# EasyEDA Pro project ProPrj_CactusConKids14_2026-02-14.epro, schematic CCK14 Schematic

## Sheets
1 MCU and Power: Board Name: CCK14 Board; Create Date: 2025-10-09; Page Name: MCU and Power; Project Name: CactusConKids14; Schematic Name: CCK14 Schematic; Update Date: 2025-12-01; Company: EasyEDA.com; Page Size: A4; Version: V1.0
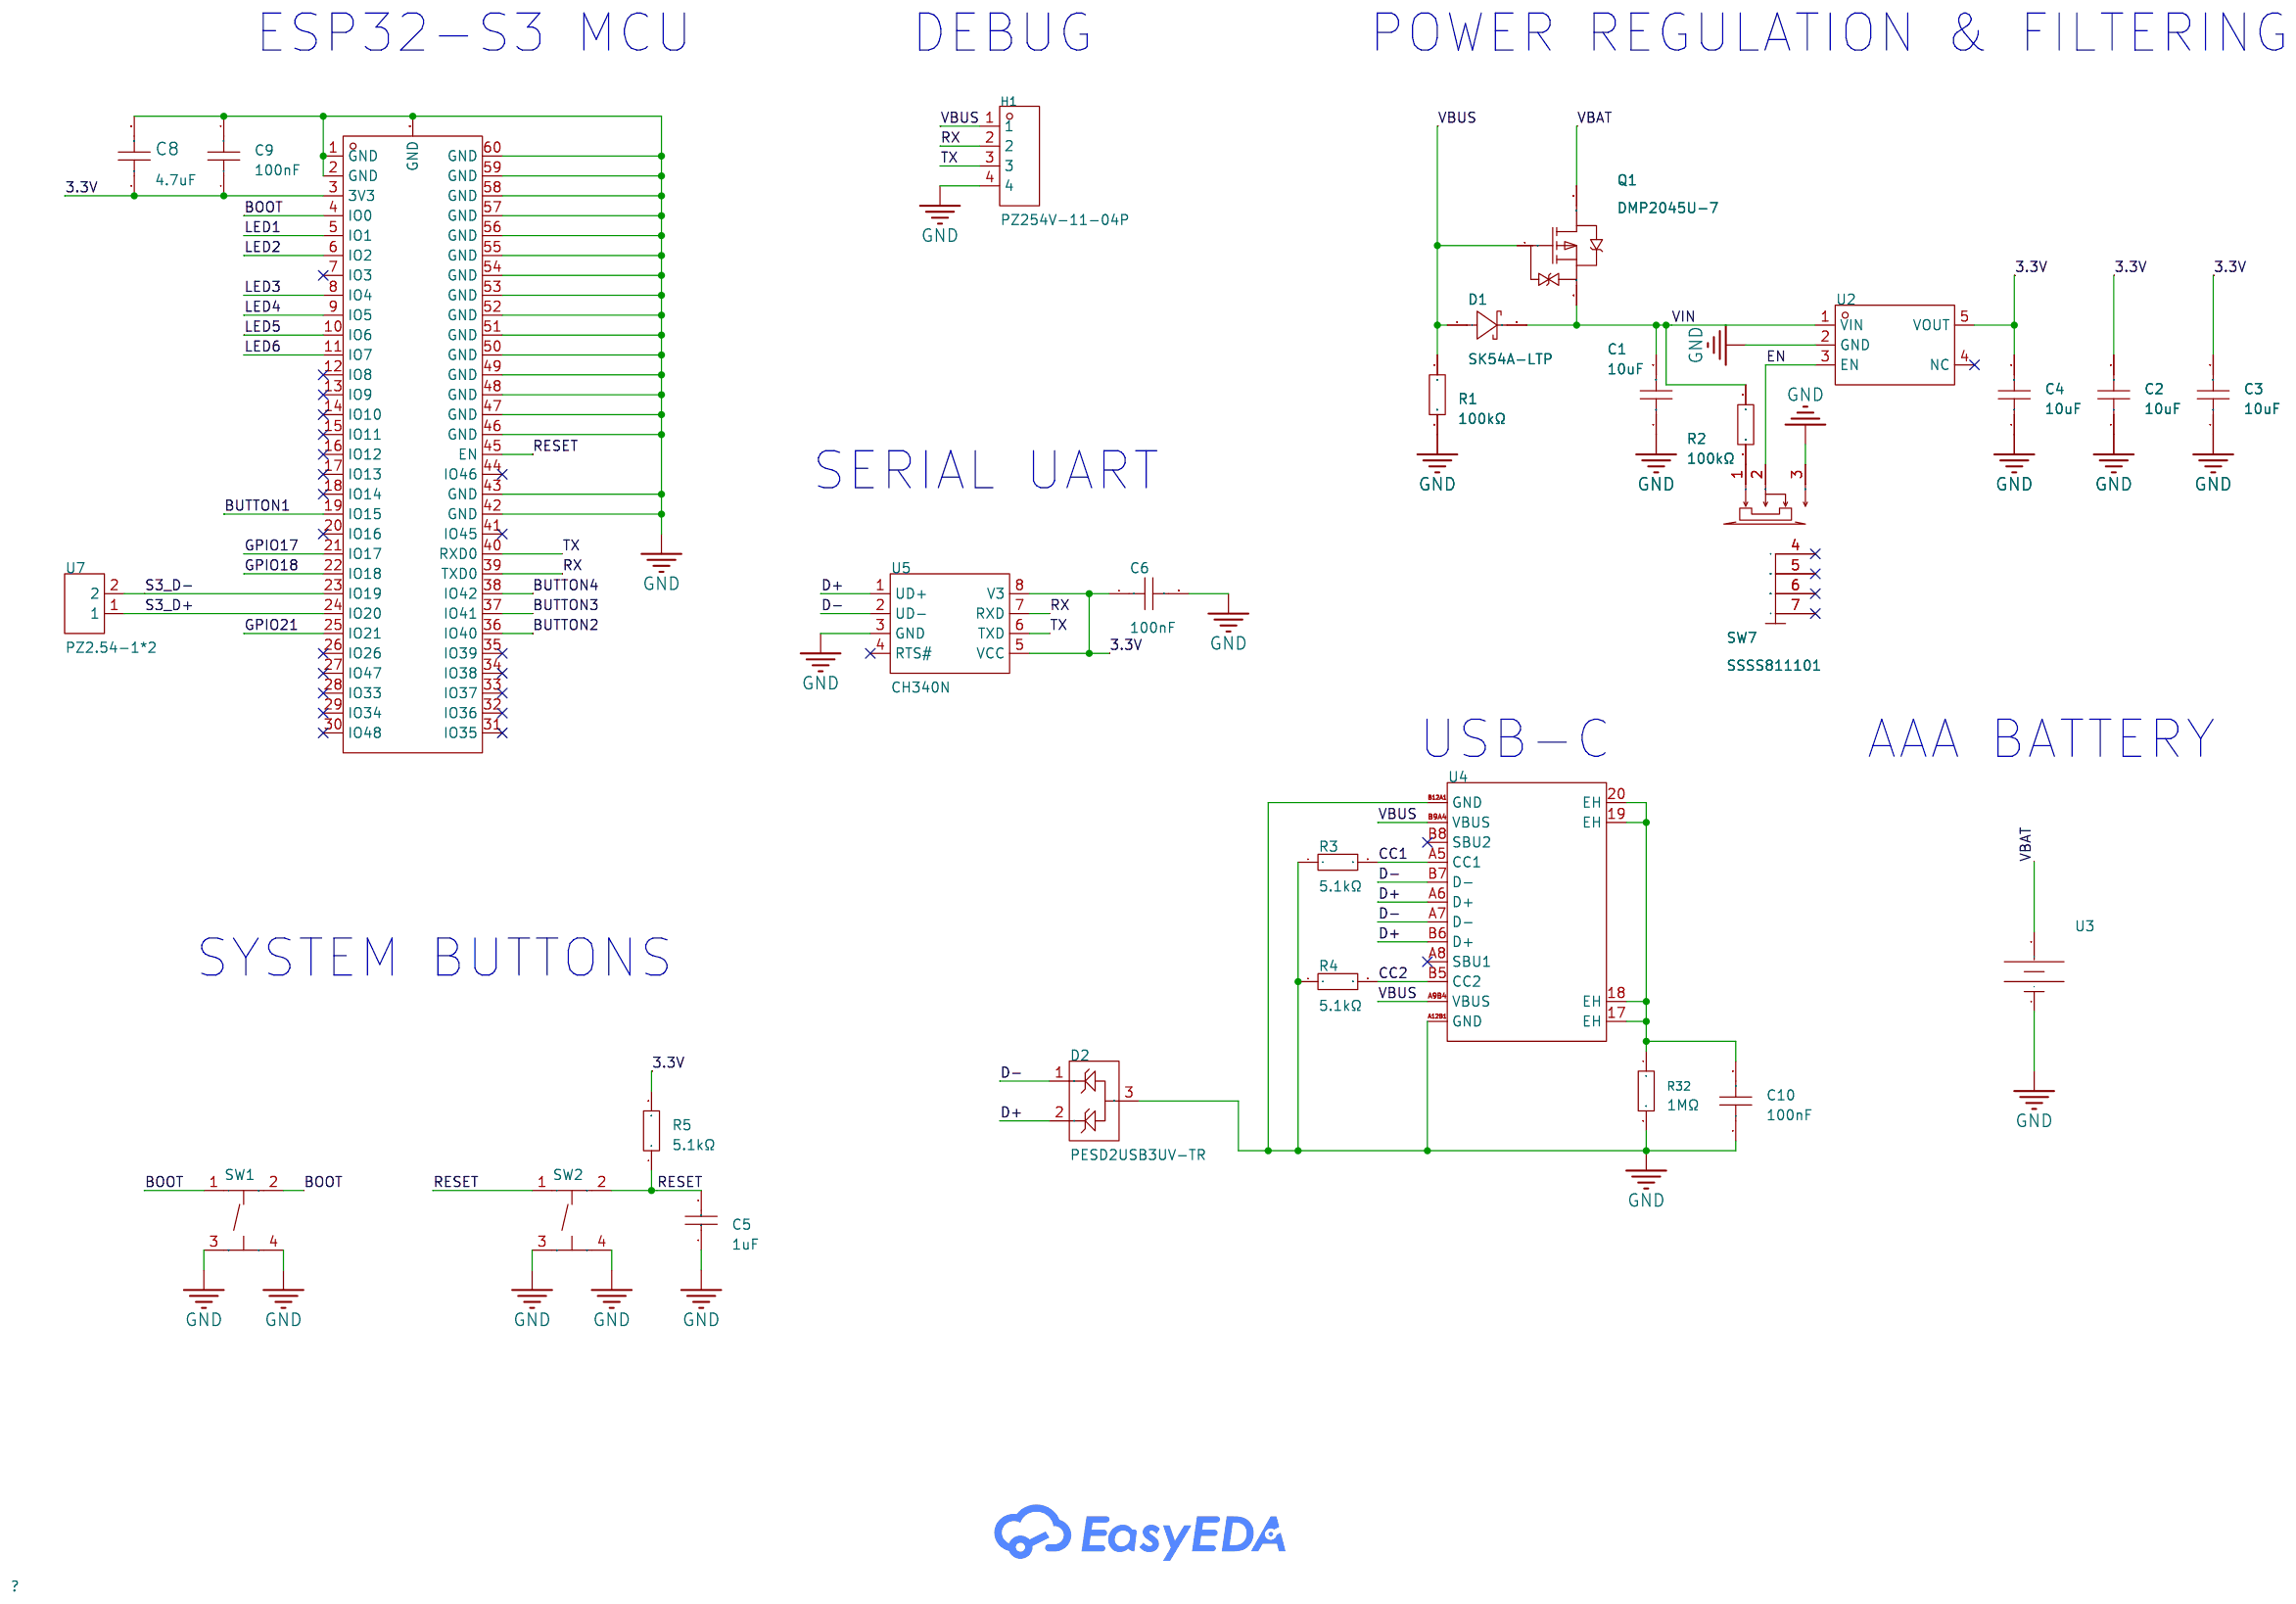
[diagram p0: MCU and Power]
2 Buttons and LEDs: Create Date: 2025-10-13; Page Name: Buttons and LEDs; Update Date: 2025-11-29
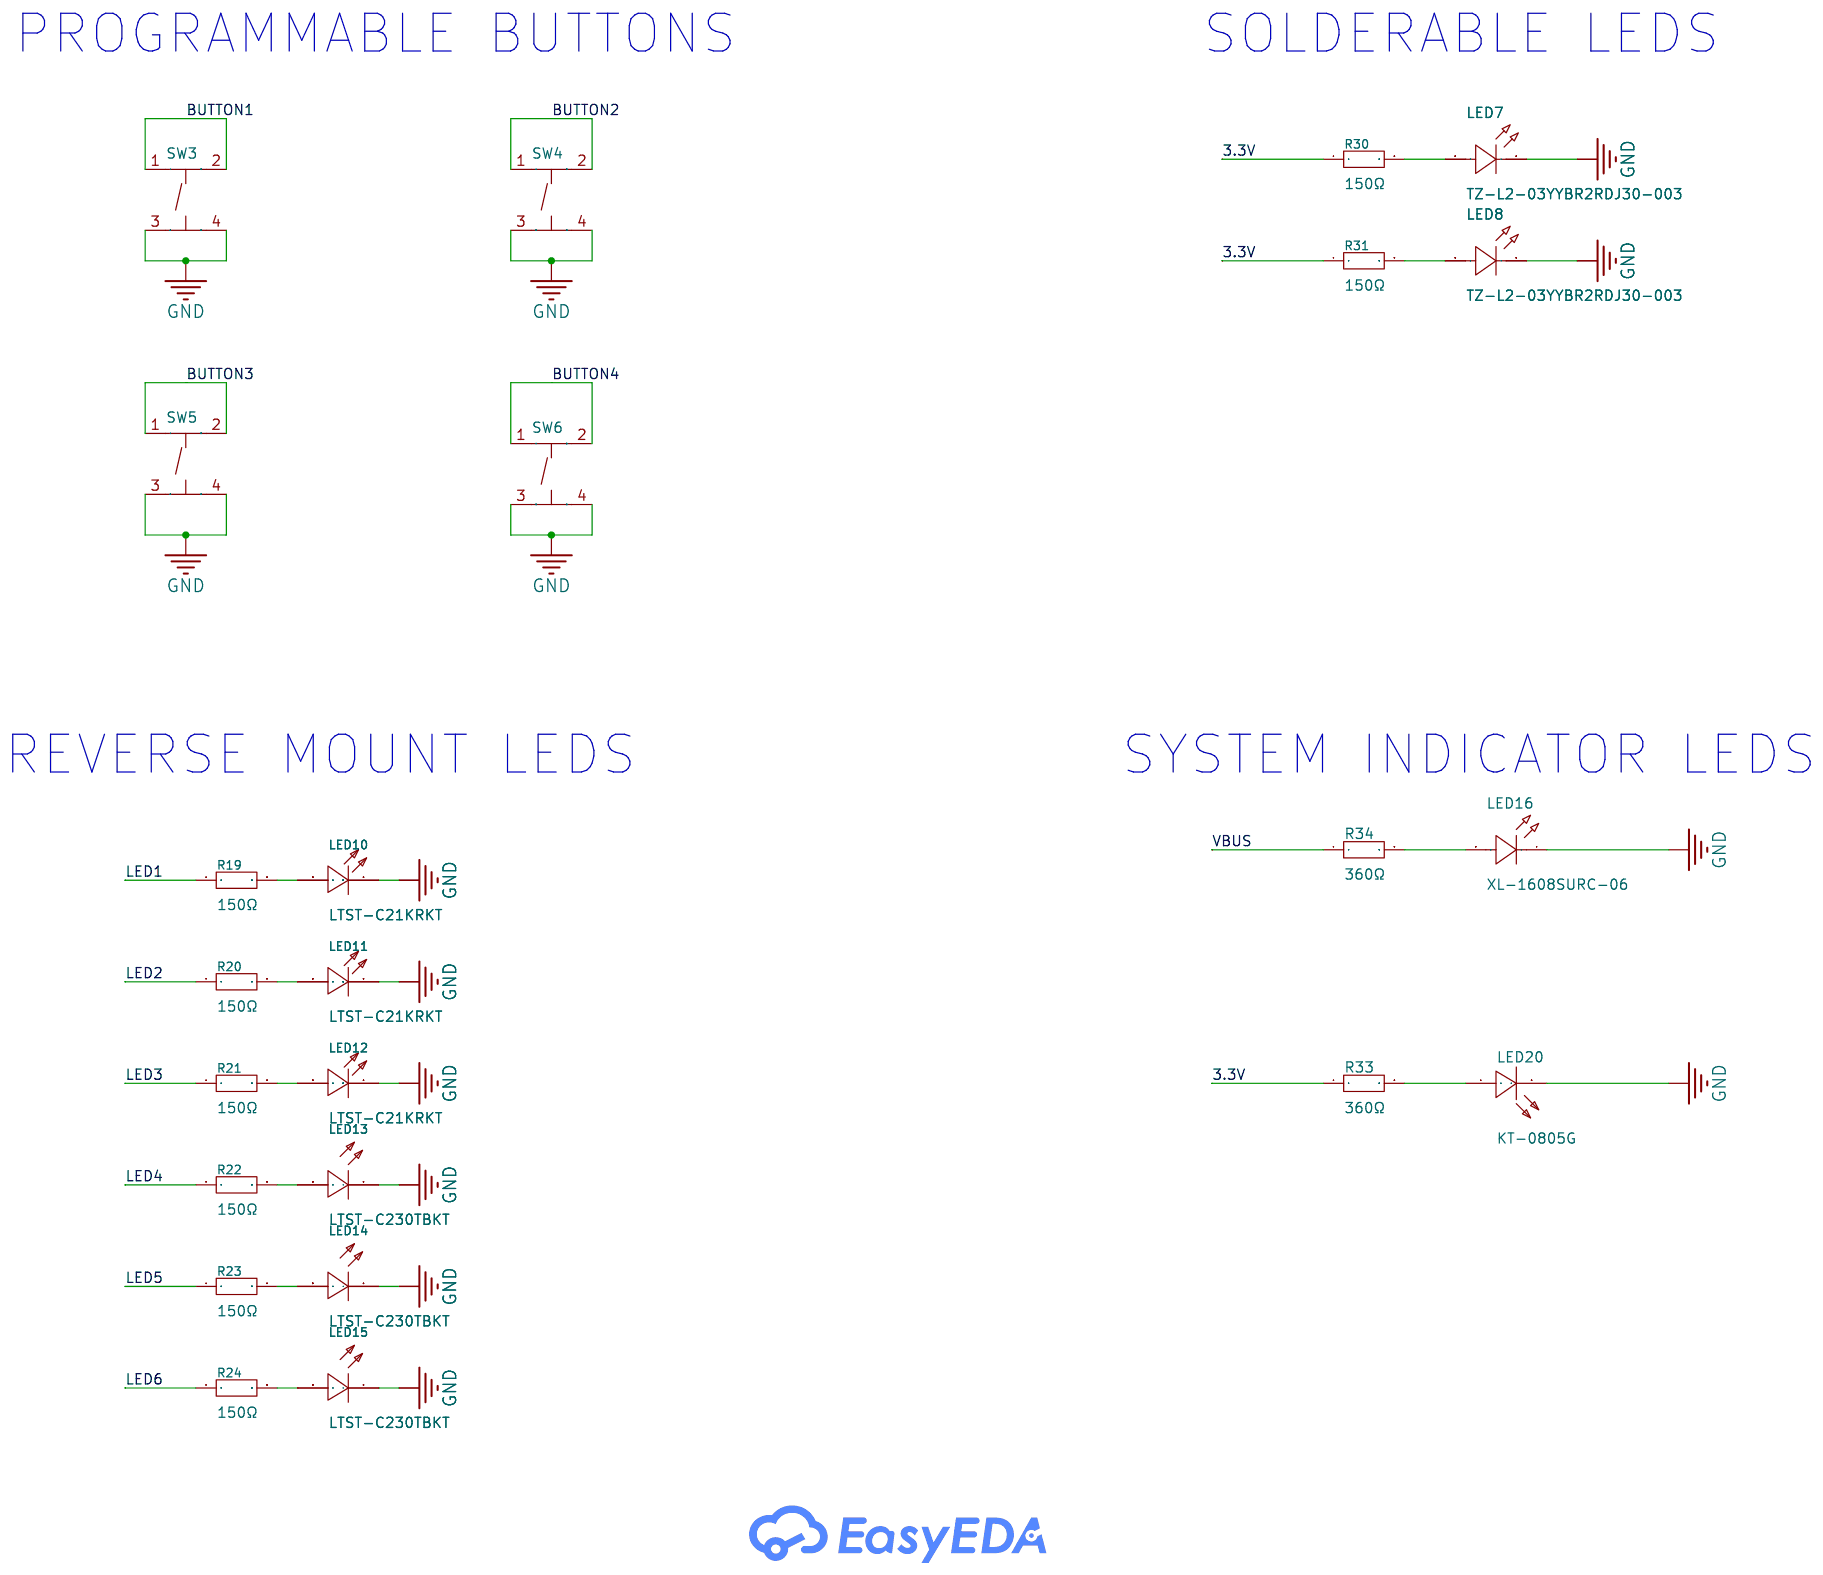
[diagram p1: Buttons and LEDs]
3 Breadboard and SAO: Create Date: 2025-11-24; Page Name: Breadboard and SAO; Update Date: 2025-11-25
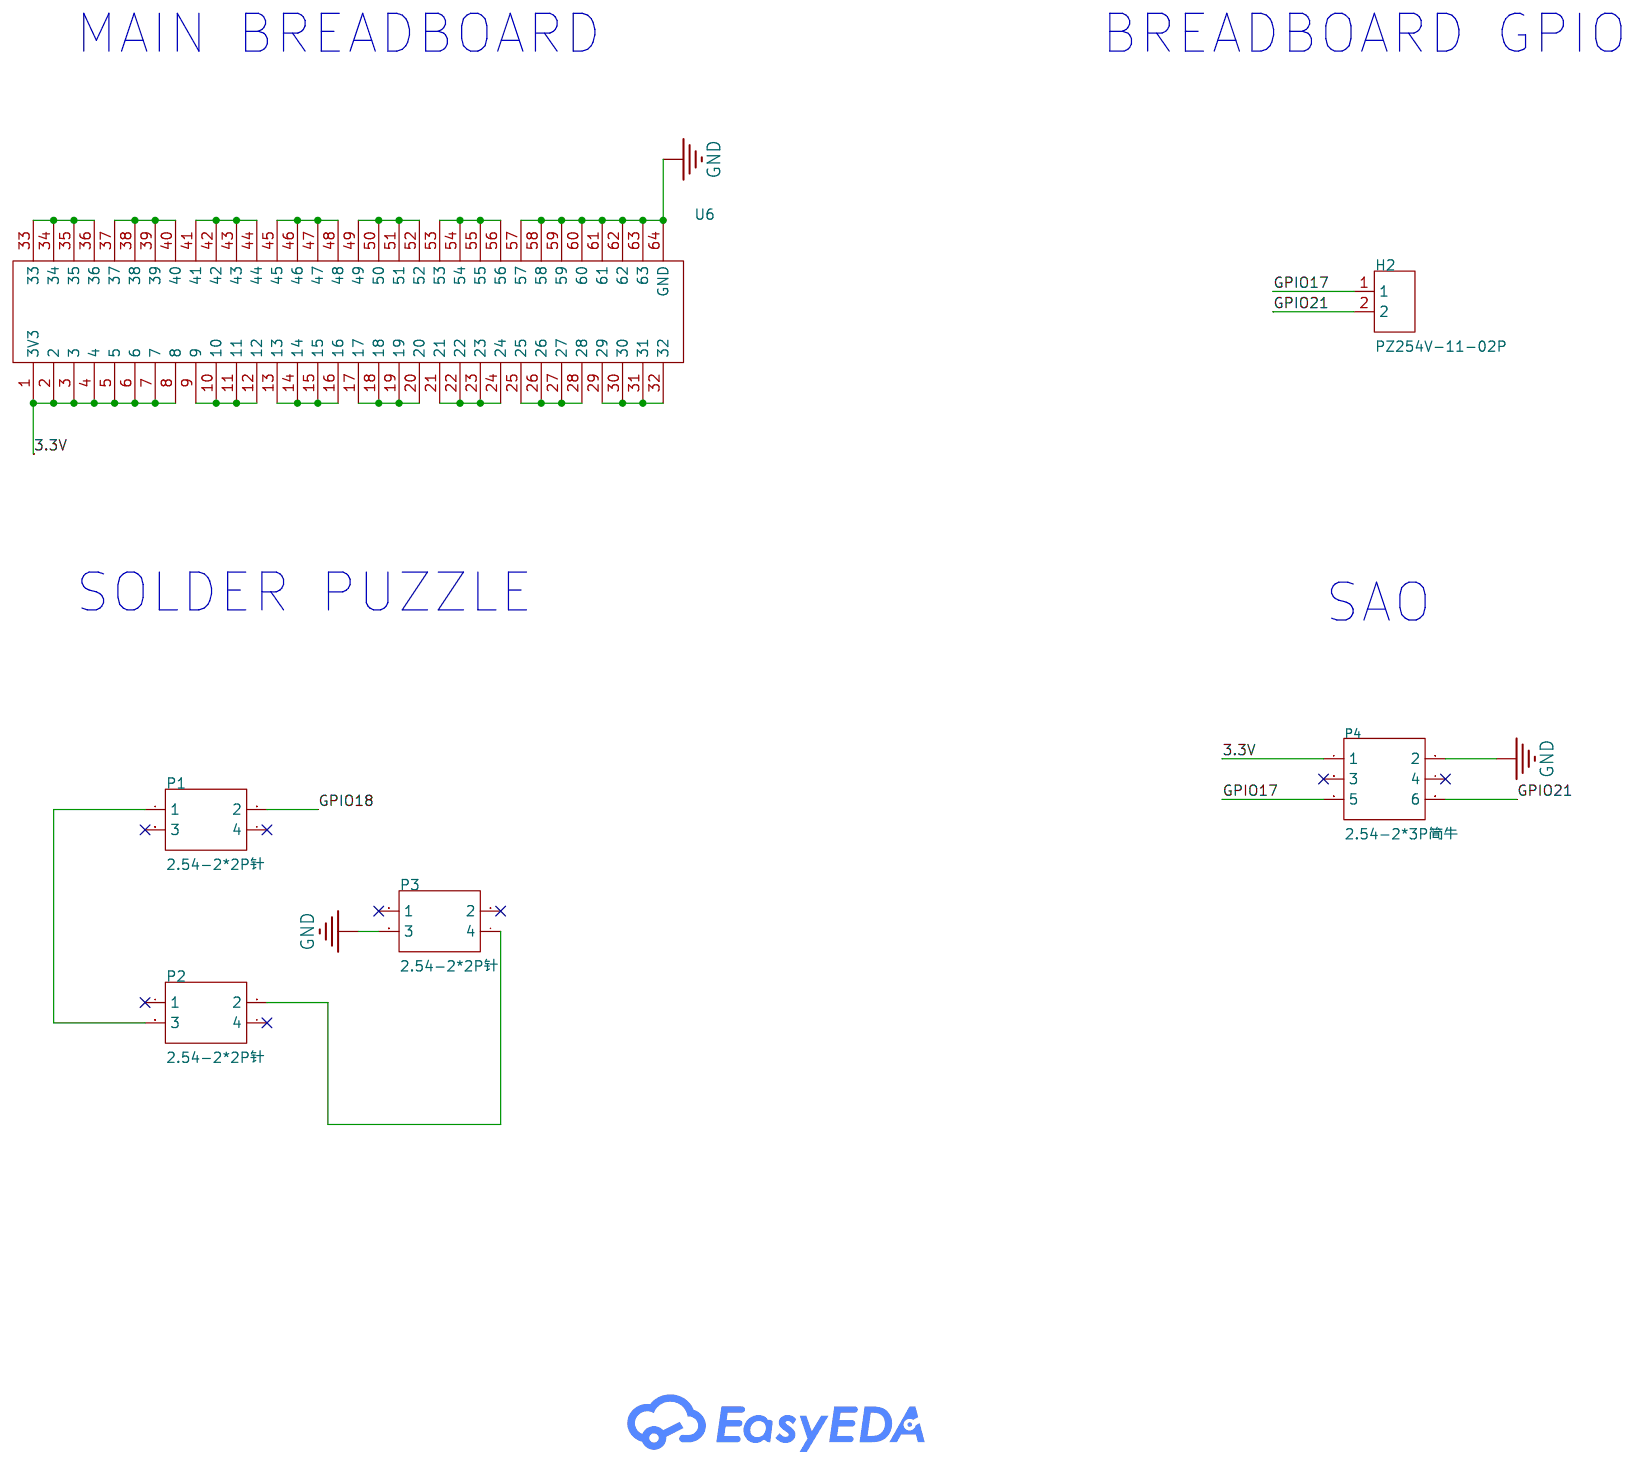
[diagram p2: Breadboard and SAO]

## Parts
sheet Breadboard and SAO
H2  PZ254V-11-02P  [HDR-TH_2P-P2.54-V-M]  (no BOM)
P1  2.54-2*2P针  [HDR-TH_4P-P2.54-V-M-R2-C2-S2.54-1]  (no BOM)
P2  2.54-2*2P针  [HDR-TH_4P-P2.54-V-M-R2-C2-S2.54-1]  (no BOM)
P3  2.54-2*2P针  [HDR-TH_4P-P2.54-V-M-R2-C2-S2.54-1]  (no BOM)
P4  2.54-2*3P简牛  [IDC-TH_6P-P2.54_C11214]  (no BOM)
U6  -  [Breadboard 8x8 3V3]  (no BOM)
sheet Buttons and LEDs
LED7  TZ-L2-03YYBR2RDJ30-003  [LED-TH_BD3.8-P2.54-RD]  (no BOM)
LED8  TZ-L2-03YYBR2RDJ30-003  [LED-TH_BD3.8-P2.54-RD]  (no BOM)
LED10  LTST-C21KRKT  [LED-SMD_L3.2-W1.6-RD-EH_RED]
LED11  LTST-C21KRKT  [LED-SMD_L3.2-W1.6-RD-EH_RED]
LED12  LTST-C21KRKT  [LED-SMD_L3.2-W1.6-RD-EH_RED]
LED13  LTST-C230TBKT  [LED1206-RD_BLUE_LTST-C230TBKT]
LED14  LTST-C230TBKT  [LED1206-RD_BLUE_LTST-C230TBKT]
LED15  LTST-C230TBKT  [LED1206-RD_BLUE_LTST-C230TBKT]
LED16  XL-1608SURC-06  [LED0603-RD_RED]
LED20  KT-0805G  [LED0805-R-RD]
R19  150Ω  [R0603]
R20  150Ω  [R0603]
R21  150Ω  [R0603]
R22  150Ω  [R0603]
R23  150Ω  [R0603]
R24  150Ω  [R0603]
R30  150Ω  [R0805]
R31  150Ω  [R0805]
R33  360Ω  [R0805]
R34  360Ω  [R0805]
SW3  TS-1187A-B-A-B  [SW-SMD_4P-L5.1-W5.1-P3.70-LS6.5-TL_H1.5]
SW4  TS-1187A-B-A-B  [SW-SMD_4P-L5.1-W5.1-P3.70-LS6.5-TL_H1.5]
SW5  TS-1187A-B-A-B  [SW-SMD_4P-L5.1-W5.1-P3.70-LS6.5-TL_H1.5]
SW6  TS-1187A-B-A-B  [SW-SMD_4P-L5.1-W5.1-P3.70-LS6.5-TL_H1.5]
sheet MCU and Power
C1  10uF  [C0603]
C2  10uF  [C0603]
C3  10uF  [C0603]
C4  10uF  [C0603]
C5  1uF  [C0402]
C6  100nF  [C0805]  (no BOM)
C8  4.7uF  [C0805]
C9  100nF  [C0805]
C10  100nF  [C0805]
D1  SK54A-LTP  [SMA_L4.4-W2.8-LS5.4-R-RD]
D2  PESD2USB3UV-TR  [SOT-23-3_L2.9-W1.3-P0.95-LS2.4-BR]
H1  PZ254V-11-04P  [HDR-TH_4P-P2.54-V-M]  (no BOM)
Q1  DMP2045U-7  [SOT-23-3_L2.9-W1.3-P1.90-LS2.4-BR-CW]
R1  100kΩ  [R0603]
R2  100kΩ  [R0603]
R3  5.1kΩ  [R0603]
R4  5.1kΩ  [R0603]
R5  5.1kΩ  [R0603]
R32  1MΩ  [R0805]
SW1  TS-1187A-B-A-B  [SW-SMD_4P-L5.1-W5.1-P3.70-LS6.5-TL_H1.5]
SW2  TS-1187A-B-A-B  [SW-SMD_4P-L5.1-W5.1-P3.70-LS6.5-TL_H1.5]
SW7  SSSS811101  [SW-SMD_SSSS811101]
U1  2.4GHz  [BULETM-SMD_ESP32-S3-MINI-1-N8]
U2  RT9080-33GJ5  [TSOT-23-5_L2.9-W1.6-P0.95-LS2.8-BL]
U3  BH-AAA-A1AJ024  [BAT-TH_BH-AAA-A1AJ024]
U4  HX TYPE-C 16PIN  [TYPE-C-SMD_HX-TYPE-C-16PIN]
U5  CH340N  [SOP-8_L4.9-W3.9-P1.27-LS6.0-BL]
U7  PZ2.54-1*2  [HDR-TH_2P-P2.54-V-M-3]  (no BOM)

## Library data of the parts
H2 = PZ254V-11-02P: Pin Structure:1x2P Pitch:2.54mm Row Spacing:- Circluar Pins/Square Pins:Pin Header Mounting Type:Through Hole Number of Rows:1 Number of Pins:2P Current Rating:- Voltage Rating (Max):- Length of Mating Pin:6mm Insulation Height:2.5mm Length of End Connect; LCSC Part Name: 1x2P 间距:2.54mm 方针 直插; Supplier Part: C492401; Manufacturer: XFCN(兴飞); Supplier Footprint: 插件,P=2.54mm; JLCPCB Part Class: Extended Part; Datasheet: https://item.szlcsc.com/datasheet/PZ254V-11-02P/502957.html; Supplier: LCSC; Pin Structure: 1x2P; Pitch: 2.54mm; Circluar Pins/Square Pins: Pin Header; Mounting Type: Through Hole; Number of Rows: 1; Number of Pins: 2P; Length of Mating Pin: 6mm; Insulation Height: 2.5mm; Length of End Connection Pin: 3mm; Contact Material: Brass; Operating Temperature: -40℃~+105℃; Color: Black
P1-P3 = 2.54-2*2P针: Pin Structure:- Pitch:2.54mm Row Spacing:2.54mm Circluar Pins/Square Pins:Pin Header Mounting Type:Through Hole Number of Rows:2 Number of Pins:4P Current Rating:3A Voltage Rating (Max):- Length of Mating Pin:6mm Insulation Height:2.5mm Length of End Conn; LCSC Part Name: 间距:2.54mm 方针 直插; Supplier Part: C66690; Manufacturer: BOOMELE(博穆精密); Supplier Footprint: 插件,P=2.54mm; JLCPCB Part Class: Extended Part; Datasheet: https://item.szlcsc.com/datasheet/2.54-2*2P%25E9%2592%2588/67776.html; Supplier: LCSC; Pitch: 2.54mm; Row Spacing: 2.54mm; Circluar Pins/Square Pins: Pin Header; Mounting Type: Through Hole; Number of Rows: 2; Number of Pins: 4P; Current Rating: 3A; Length of Mating Pin: 6mm; Insulation Height: 2.5mm; Length of End Connection Pin: 3mm; Contact Material: Brass; Contact Plating: Gold; Operating Temperature: -55℃~+105℃; Color: Black
P4 = 2.54-2*3P简牛: Connector Type:IDC Header Pitch:2.54mm Holder Type:Through Hole Row Spacing:2.54mm Number of Rows:2 Contact Material:Brass Contact Plating:Gold; LCSC Part Name: 2.54mm 排数:2; Supplier Part: C11214; Manufacturer: BOOMELE(博穆精密); Supplier Footprint: 插件,P=2.54mm; JLCPCB Part Class: Extended Part; Datasheet: https://item.szlcsc.com/datasheet/2.54-2*3P%25E7%25AE%2580%25E7%2589%259B/11763.html; Supplier: LCSC; Connector Type: IDC Header; Pitch: 2.54mm; Holder Type: Through Hole; Row Spacing: 2.54mm; Number of Rows: 2; Contact Material: Brass; Contact Plating: Gold
U6 = Breadboard 8x8 3v3
LED7 LED8 = TZ-L2-03YYBR2RDJ30-003: Lamp Holder Type:3mm Round Lens Illumination Color:Red Voltage - Forward(Vf):2.3V Voltage - Forward(Vf):2.3V Power(Watts):60mW Forward Current:20mA Wavelength - Dominant:620nm~625nm Wavelength - Dominant:620nm~625nm Peak Wavelength:- Diode Configuration:-; LCSC Part Name: 红灯; Supplier Part: C779429; Manufacturer: TUOZHAN(拓展光电); Supplier Footprint: 插件,D=3mm; JLCPCB Part Class: Extended Part; Datasheet: https://item.szlcsc.com/datasheet/TZ-L2-03YYBR2RDJ30-003/829090.html; Supplier: LCSC; Lamp Holder Type: 3mm Round Lens; Illumination Color: Red; Voltage - Forward(Vf): 2.3V; Power(Watts): 60mW; Forward Current: 20mA; Wavelength - Dominant: 620nm~625nm; Lens Color: Red Lens; Luminous Intensity: 600mcd; Viewing Angle: 30°; Operating Temperature: -20℃~+75℃
LED10-LED12 = LTST-C21KRKT: Illumination Color:Red Voltage - Forward(Vf):2V Voltage - Forward(Vf):2V Power(Watts):75mW Forward Current:20mA Wavelength - Dominant:631nm Wavelength - Dominant:631nm Peak Wavelength:639nm Diode Configuration:- Lens Color:Water Clear Color Temperature:-; LCSC Part Name: 红灯 反贴; Supplier Part: C284939; Manufacturer: LITEON(光宝); Supplier Footprint: 1206; JLCPCB Part Class: Extended Part; Datasheet: https://item.szlcsc.com/datasheet/LTST-C21KRKT/270336.html; Supplier: LCSC; Illumination Color: Red; Voltage - Forward(Vf): 2V; Power(Watts): 75mW; Forward Current: 20mA; Wavelength - Dominant: 631nm; Peak Wavelength: 639nm; Lens Color: Water Clear; Luminous Intensity: 100mcd; Viewing Angle: 70°; Mounting Style: Reverse Mount; Operating Temperature: -55℃~+85℃
LED13-LED15 = LTST-C230TBKT: Emitted Color:Blue Forward Voltage (VF):3.3V Forward Voltage (VF):3.3V Power Dissipation:120mW Forward Current:20mA Dominant Wavelength:465nm~475nm Dominant Wavelength:465nm~475nm Peak Wavelength:468nm Diode Configuration:- Lens Color:无色透明透镜 Color Tempera; LCSC Part Name: 蓝灯 反贴; Supplier Part: C125109; Manufacturer: LITEON(光宝); Supplier Footprint: 1206; JLCPCB Part Class: Extended Part; Datasheet: https://atta.szlcsc.com/upload/public/pdf/source/20180326/C125109_FE0F3F783DF6A8FC8DF58416A62E162F.pdf; Supplier: LCSC; Emitted Color: Blue; Forward Voltage (VF): 3.3V; Power Dissipation: 120mW; Forward Current: 20mA; Dominant Wavelength: 465nm~475nm; Peak Wavelength: 468nm; Lens Color: 无色透明透镜; Luminous Intensity: 104mcd; Viewing Angle: 130°; Mounting Sytle: Counterpost; Operating Temperature: -20℃~+80℃
LED16 = XL-1608SURC-06: Lamp Holder Type:- Illumination Color:Red Voltage - Forward(Vf):2.3V Voltage - Forward(Vf):2.3V Power(Watts):50mW Forward Current:20mA Wavelength - Dominant:620nm~630nm Wavelength - Dominant:620nm~630nm Peak Wavelength:625nm Diode Configuration:- Lens Col; LCSC Part Name: 0603红色贴片式发光二极管; Supplier Part: C965799; Manufacturer: XINGLIGHT(成兴光); Supplier Footprint: 0603; JLCPCB Part Class: Extended Part; Datasheet: https://item.szlcsc.com/datasheet/XL-1608SURC-06/1051408.html; Supplier: LCSC; Illumination Color: Red; Voltage - Forward(Vf): 2.3V; Power(Watts): 50mW; Forward Current: 20mA; Wavelength - Dominant: 620nm~630nm; Peak Wavelength: 625nm; Lens Color: Water Clear; Luminous Intensity: 225mcd; Viewing Angle: 120°; Mounting Style: op View Mount; Operating Temperature: -40℃~+85℃
LED20 = KT-0805G: Lamp Holder Type:- Illumination Color:Emerald Green Voltage - Forward(Vf):2.6V~3.1V Voltage - Forward(Vf):2.6V~3.1V Power(Watts):100mW Forward Current:5mA Wavelength - Dominant:513nm~528nm Wavelength - Dominant:513nm~528nm Peak Wavelength:525nm Diode Conf; LCSC Part Name: 0805 翠绿 高亮; Supplier Part: C2297; Manufacturer: KENTO; Supplier Footprint: 0805; JLCPCB Part Class: Basic Part; Datasheet: https://item.szlcsc.com/datasheet/KT-0805G/2670.html; Supplier: LCSC; Illumination Color: Emerald Green; Voltage - Forward(Vf): 2.6V~3.1V; Power(Watts): 100mW; Forward Current: 5mA; Wavelength - Dominant: 513nm~528nm; Peak Wavelength: 525nm; Luminous Intensity: 430mcd; Viewing Angle: 120°; Operating Temperature: -40℃~+85℃
R19-R24 = 0603WAF1500T5E: Type:Thick Film Resistors Resistance: Tolerance:±1% Tolerance:±1% Power(Watts): Overload Voltage (Max): Temperature Coefficient:±100ppm/℃ Temperature Coefficient:±100ppm/℃ Operating Temperature Range:-55℃~+155℃ Operating Temperature Range:-55℃~+155℃; LCSC Part Name: 150Ω ±1% 100mW 厚膜电阻; Supplier Part: C22808; Manufacturer: UNI-ROYAL(厚声); Supplier Footprint: 0603; JLCPCB Part Class: Basic Part; Datasheet: https://atta.szlcsc.com/upload/public/pdf/source/20200306/C422600_1E6D84923E4A46A82E41ADD87F860B5C.pdf; Supplier: LCSC; Type: Thick Film Resistors; Tolerance: ±1%; Temperature Coefficient: ±100ppm/℃; Operating Temperature Range: -55℃~+155℃
R30 R31 = 0805W8F1500T5E: Type:Thick Film Resistor Resistance:150Ω Tolerance:±1% Tolerance:±1% Power(Watts):125mW Voltage-Supply(Max):150V Temperature Coefficient:±100ppm/℃ Temperature Coefficient:±100ppm/℃ Operating Temperature:-55℃~+155℃ Operating Temperature:-55℃~+155℃; LCSC Part Name: 150Ω ±1% 125mW 厚膜电阻; Supplier Part: C17471; Manufacturer: UNI-ROYAL(厚声); Supplier Footprint: 0805; JLCPCB Part Class: Basic Part; Datasheet: https://item.szlcsc.com/datasheet/0805W8F1500T5E/18159.html; Supplier: LCSC; Type: Thick Film Resistor; Tolerance: ±1%; Power(Watts): 125mW; Voltage-Supply(Max): 150V; Temperature Coefficient: ±100ppm/℃; Operating Temperature: -55℃~+155℃
R33 R34 = 0805W8J0361T5E: Type:Thick Film Resistors Resistance: Tolerance:±5% Tolerance:±5% Power(Watts): Overload Voltage (Max): Temperature Coefficient:±100ppm/℃ Temperature Coefficient:±100ppm/℃ Operating Temperature Range:-55℃~+155℃ Operating Temperature Range:-55℃~+155℃; LCSC Part Name: 360Ω ±5% 125mW 厚膜电阻; Supplier Part: C25308; Manufacturer: UNI-ROYAL(厚声); Supplier Footprint: 0805; JLCPCB Part Class: Extended Part; Datasheet: https://atta.szlcsc.com/upload/public/pdf/source/20200306/C422600_1E6D84923E4A46A82E41ADD87F860B5C.pdf; Supplier: LCSC; Type: Thick Film Resistors; Tolerance: ±5%; Temperature Coefficient: ±100ppm/℃; Operating Temperature Range: -55℃~+155℃
SW1-SW6 = TS-1187A-B-A-B: Circuit:SPST Actuator Style:Round Button Operating Force:1.6N Mounting Type:Surface Mount,Vertical Length:5.1mm Width:5.1mm Switch Height:1.5mm with Bracket:Without Bracket Contact Current:50mA Voltage Rating:12V Actuator/Cap Color:Gold With Lamp:No Life:; LCSC Part Name: 5.1*5.1*1.5mm 立贴 轻触开关; Supplier Part: C318884; Manufacturer: XKB Connection(中国星坤); Supplier Footprint: SMD; JLCPCB Part Class: Basic Part; Datasheet: https://item.szlcsc.com/datasheet/TS-1187A-B-A-B/299976.html; Supplier: LCSC; Circuit: SPST; Actuator Style: Round Button; Operating Force: 1.6N; Mounting Type: Surface Mount,Vertical; Length: 5.1mm; Width: 5.1mm; Switch Height: 1.5mm; with Bracket: Without Bracket; Contact Current: 50mA; Voltage Rating: 12V; Actuator/Cap Color: Gold; With Lamp: No; Life: 100,000 Cycles; Operating Temperature: -30℃~+85℃
C1-C4 = CL10A106KP8NNNC: Capacitance:10uF Tolerance:±10% Tolerance:±10% Voltage Rating:10V Temperature Coefficient:X5R; LCSC Part Name: 10uF ±10% 10V; Supplier Part: C19702; Manufacturer: SAMSUNG(三星); Supplier Footprint: 0603; JLCPCB Part Class: Basic Part; Datasheet: https://item.szlcsc.com/datasheet/CL10A106KP8NNNC/20411.html; Supplier: LCSC; Tolerance: ±10%; Voltage Rating: 10V; Temperature Coefficient: X5R
C5 = CL05A105KP5NNNC: Capacitance:1uF Tolerance:±10% Tolerance:±10% Voltage Rating:10V Temperature Coefficient:X5R; LCSC Part Name: 1uF ±10% 10V; Supplier Part: C14445; Manufacturer: SAMSUNG(三星); Supplier Footprint: 0402; JLCPCB Part Class: Extended Part; Datasheet: https://item.szlcsc.com/datasheet/CL05A105KP5NNNC/15107.html; Supplier: LCSC; Tolerance: ±10%; Voltage Rating: 10V; Temperature Coefficient: X5R
C6 = CC0805KRX7R9BB104: Capacitance:100nF Tolerance:±10% Tolerance:±10% Voltage Rating:50V Temperature Coefficient:X7R; LCSC Part Name: 100nF ±10% 50V; Supplier Part: C49678; Manufacturer: YAGEO(国巨); Supplier Footprint: 0805; JLCPCB Part Class: Basic Part; Datasheet: https://item.szlcsc.com/datasheet/CC0805KRX7R9BB104/50686.html; Supplier: LCSC; Tolerance: ±10%; Voltage Rating: 50V; Temperature Coefficient: X7R
C8 = 0805X475K100CT: Capacitance: Tolerance:±10% Tolerance:±10% Voltage Rated: Temperature Coefficient:; LCSC Part Name: 4.7uF ±10% 10V; Supplier Part: C123653; Manufacturer: Walsin(华新科); Supplier Footprint: 0805; JLCPCB Part Class: Extended Part; Datasheet: https://atta.szlcsc.com/upload/public/pdf/source/20191217/C469650_84AD5C6F618CF4AC0C6D987F2E8FE6F8.pdf; Supplier: LCSC; Tolerance: ±10%
C9 C10 = GRM21BR71H104KA01L: Capacitance:100nF Tolerance:±10% Tolerance:±10% Voltage Rating:50V Temperature Coefficient:X7R; LCSC Part Name: 100nF ±10% 50V; Supplier Part: C77082; Manufacturer: muRata(村田); Supplier Footprint: 0805; JLCPCB Part Class: Extended Part; Datasheet: https://item.szlcsc.com/datasheet/GRM21BR71H104KA01L/78209.html; Supplier: LCSC; Tolerance: ±10%; Voltage Rating: 50V; Temperature Coefficient: X7R
D1 = SK54A-LTP: Diode Configuration:- Voltage - Forward(Vf@If):550mV@5A Voltage - DC Reverse(Vr):40V Current - Rectified:5A Reverse Leakage Current (Ir):100uA@40V Operating Junction Temperature Range:-55℃~+150℃ Operating Junction Temperature Range:-55℃~+150℃ Non-Repetiti; LCSC Part Name: 电压:40V 电流:5A; Supplier Part: C669017; Manufacturer: MCC(美微科); Supplier Footprint: SMA(DO-214AC); JLCPCB Part Class: Extended Part; Datasheet: https://item.szlcsc.com/datasheet/SK54A-LTP/699076.html; Supplier: LCSC; Voltage - Forward(Vf@If): 550mV@5A; Voltage - DC Reverse(Vr): 40V; Current - Rectified: 5A; Reverse Leakage Current (Ir): 100uA@40V; Operating Junction Temperature Range: -55℃~+150℃; Non-Repetitive Peak Forward Surge Current: 100A
D2 = PESD2USB3UV-TR: Reverse Stand-Off Voltage (Vrwm):5V Clamping Voltage:18V Peak Pulse Current (Ipp):20A@8/20us Peak Pulse Power Dissipation (Ppp):350W@8/20us Voltage - Breakdown:6.4V Reverse Leakage Current (Ir):100nA Operating Temperature:-55℃~+125℃ Operating Temperature:; LCSC Part Name: 5V截止 峰值浪涌电流：20A@8/20us; Supplier Part: C7202955; Manufacturer: TECH PUBLIC(台舟); Supplier Footprint: SOT-23; JLCPCB Part Class: Extended Part; Datasheet: https://item.szlcsc.com/datasheet/PESD2USB3UV-TR/8170913.html; Supplier: LCSC; Reverse Stand-Off Voltage (Vrwm): 5V; Clamping Voltage: 18V; Peak Pulse Current (Ipp): 20A@8/20us; Peak Pulse Power Dissipation (Ppp): 350W@8/20us; Voltage - Breakdown: 6.4V; Reverse Leakage Current (Ir): 100nA; Operating Temperature: -55℃~+125℃; level of protection: IEC 61000-4-4；IEC 61000-4-5；IEC 61000-4-2; Junction Capacitance: 1.3pF
H1 = PZ254V-11-04P: Pin Structure:1x4P Pitch:2.54mm Row Spacing:- Circluar Pins/Square Pins:Pin Header Mounting Type:Through Hole Number of Rows:1 Number of Pins:4P Current Rating:3A Voltage Rating (Max):250V Length of Mating Pin:6mm Insulation Height:2.5mm Length of End Con; LCSC Part Name: 1x4P 间距:2.54mm 方针 直插; Supplier Part: C2691448; Manufacturer: XFCN(兴飞); Supplier Footprint: 插件,P=2.54mm; JLCPCB Part Class: Extended Part; Datasheet: https://item.szlcsc.com/datasheet/PZ254V-11-04P/2801085.html; Supplier: LCSC; Pin Structure: 1x4P; Pitch: 2.54mm; Circluar Pins/Square Pins: Pin Header; Mounting Type: Through Hole; Number of Rows: 1; Number of Pins: 4P; Current Rating: 3A; Voltage Rating (Max): 250V; Length of Mating Pin: 6mm; Insulation Height: 2.5mm; Length of End Connection Pin: 3mm; Operating Temperature: -40℃~+105℃; Color: Black
Q1 = DMP2045U-7: Number:1 P-Channel Drain to Source Voltage:20V Current - Continuous Drain(Id):4.3A RDS(on):90mΩ@1.8V,3.1A Pd - Power Dissipation:800mW Gate Threshold Voltage (Vgs(th)):1V Gate Charge(Qg):6.8nC Input Capacitance(Ciss):634pF@10V Reverse Transfer Capacitance; LCSC Part Name: 1个P沟道 耐压:20V 电流:4.3A; Supplier Part: C459541; Manufacturer: DIODES(美台); Supplier Footprint: SOT-23; JLCPCB Part Class: Extended Part; Datasheet: https://item.szlcsc.com/datasheet/DMP2045U-7/463832.html; Supplier: LCSC; Number: 1 P-Channel; Drain to Source Voltage: 20V; Current - Continuous Drain(Id): 4.3A; RDS(on): 90mΩ@1.8V,3.1A; Pd - Power Dissipation: 800mW; Gate Threshold Voltage (Vgs(th)): 1V; Gate Charge(Qg): 6.8nC; Input Capacitance(Ciss): 634pF@10V; Reverse Transfer Capacitance (Crss@Vds): 66pF; Operating Temperature: -55℃~+150℃
R1 R2 = 0603WAF1003T5E: Type:Thick Film Resistor Resistance:100kΩ Tolerance:±1% Tolerance:±1% Power(Watts):100mW Voltage-Supply(Max):75V Temperature Coefficient:±100ppm/℃ Temperature Coefficient:±100ppm/℃ Operating Temperature:-55℃~+155℃ Operating Temperature:-55℃~+155℃; LCSC Part Name: 100kΩ ±1% 100mW 厚膜电阻; Supplier Part: C25803; Manufacturer: UNI-ROYAL(厚声); Supplier Footprint: 0603; JLCPCB Part Class: Basic Part; Datasheet: https://item.szlcsc.com/datasheet/0603WAF1003T5E/26546.html; Supplier: LCSC; Type: Thick Film Resistor; Tolerance: ±1%; Power(Watts): 100mW; Voltage-Supply(Max): 75V; Temperature Coefficient: ±100ppm/℃; Operating Temperature: -55℃~+155℃
R3-R5 = 0603WAF5101T5E: Type:Thick Film Resistor Resistance:5.1kΩ Tolerance:±1% Tolerance:±1% Power(Watts):100mW Voltage-Supply(Max):75V Temperature Coefficient:±100ppm/℃ Temperature Coefficient:±100ppm/℃ Operating Temperature:-55℃~+155℃ Operating Temperature:-55℃~+155℃; LCSC Part Name: 5.1kΩ ±1% 100mW 厚膜电阻; Supplier Part: C23186; Manufacturer: UNI-ROYAL(厚声); Supplier Footprint: 0603; JLCPCB Part Class: Basic Part; Datasheet: https://item.szlcsc.com/datasheet/0603WAF5101T5E/23913.html; Supplier: LCSC; Type: Thick Film Resistor; Tolerance: ±1%; Power(Watts): 100mW; Voltage-Supply(Max): 75V; Temperature Coefficient: ±100ppm/℃; Operating Temperature: -55℃~+155℃
R32 = 0805W8F1004T5E: Type:Thick Film Resistors Resistance:1MΩ Tolerance:±1% Tolerance:±1% Power(Watts): Overload Voltage (Max): Temperature Coefficient:±100ppm/℃ Temperature Coefficient:±100ppm/℃ Operating Temperature Range:-55℃~+155℃ Operating Temperature Range:-55℃~+155℃; LCSC Part Name: 1MΩ ±1% 125mW 厚膜电阻; Supplier Part: C17514; Manufacturer: UNI-ROYAL(厚声); Supplier Footprint: 0805; JLCPCB Part Class: Basic Part; Datasheet: https://atta.szlcsc.com/upload/public/pdf/source/20200306/C422600_1E6D84923E4A46A82E41ADD87F860B5C.pdf; Supplier: LCSC; Type: Thick Film Resistors; Tolerance: ±1%; Temperature Coefficient: ±100ppm/℃; Operating Temperature Range: -55℃~+155℃
SW7 = SSSS811101: Circuit:SPDT Actuator Style:Rectangular Columnar Termination Style:SMD(SMT) Tab Switch Height:4.1mm Mounting Type:Surface Mount, Right Angle Current Rating:300mA Voltage Rating:5V Life:10,000 Cycles Operating Temperature:-40℃~+85℃ Operating Temperature:-4; Supplier Part: C109335; Manufacturer: ALPSALPINE(阿尔卑斯阿尔派); Supplier Footprint: SMD; JLCPCB Part Class: Extended Part; Datasheet: https://item.szlcsc.com/datasheet/SSSS811101/110556.html; Supplier: LCSC; Circuit: SPDT; Actuator Style: Rectangular Columnar; Termination Style: SMD(SMT) Tab; Switch Height: 4.1mm; Mounting Type: Surface Mount, Right Angle; Current Rating: 300mA; Voltage Rating: 5V; Life: 10,000 Cycles; Operating Temperature: -40℃~+85℃
U1 = ESP32-S3-MINI-1-N8: Core Processor:ESP32-S3FN8 Chip Wireless Standard:- Support Interface:I2C；GPIO；SPI；PWM；ADC；UART；USB；I2S Frequency:2.4GHz Antenna Type:- Output Power:20.5dBm Output Power:20.5dBm Operating Voltage:- Operating Voltage:- Receive  Current:- Send  Current:- Se; Supplier Part: C2913206; Manufacturer: ESPRESSIF(乐鑫); Supplier Footprint: SMD; JLCPCB Part Class: Extended Part; Datasheet: https://atta.szlcsc.com/upload/public/pdf/source/20220425/7F117D7A09F85946280540FD9EFDF9F3.pdf; Supplier: LCSC; Core Processor: ESP32-S3FN8 Chip; Support Interface: I2C；GPIO；SPI；PWM；ADC；UART；USB；I2S; Output Power: 20.5dBm
U2 = RT9080-33GJ5: Output Type:Fixed Voltage - Supply:5.5V Output Voltage:3.3V Output Voltage:3.3V Output Current:600mA Power Supply Rejection Ratio (PSRR):75dB@(1kHz) Voltage Dropout:360mV@(600mA) standby current:2uA Noise:42uVrms Features:Enable；Over Temperature Protectio; Supplier Part: C841192; Manufacturer: RICHTEK(立锜); Supplier Footprint: TSOT-23-5; JLCPCB Part Class: Extended Part; Datasheet: https://item.szlcsc.com/datasheet/RT9080-33GJ5/897967.html; Supplier: LCSC; Output Type: Fixed; Voltage - Supply: 5.5V; Output Voltage: 3.3V; Output Current: 600mA; Power Supply Rejection Ratio (PSRR): 75dB@(1kHz); Voltage Dropout: 360mV@(600mA); standby current: 2uA; Noise: 42uVrms; Features: Enable；Over Temperature Protection；Over Current Protection; Operating Temperature: -40℃~+125℃@(Tj); Output Configuration: Positive; Number of Outputs: 1
U3 = BH-AAA-A1AJ024: Connector Type:Battery Holder Battery Type:AAA Contact Plating:Nickel Operating Temperature:-10℃~+100℃ Operating Temperature:-10℃~+100℃; LCSC Part Name: 电池盒 适用电池:7号; Supplier Part: C5290193; Manufacturer: MYOUNG(美阳); JLCPCB Part Class: Extended Part; Datasheet: https://item.szlcsc.com/datasheet/BH-AAA-A1AJ024/6030899.html; Supplier: LCSC; Connector Type: Battery Holder; Battery Type: AAA; Contact Plating: Nickel; Operating Temperature: -10℃~+100℃
U4 = HX TYPE-C 16PIN: Connector Type:Type-C Protocol Standard:USB 3.1 Gender:Female Mounting Type:Surface Mount, Right Angle Number of Contacts:16P Number of Ports:1 Current Rating-Power:3A Voltage Rating:20V Connect-Disconnect Life:5,000 Cycles Supplementary Features:- Center; LCSC Part Name: Type-C 母 卧贴; Supplier Part: C5178539; Manufacturer: hanxia(韩下); Supplier Footprint: SMD; JLCPCB Part Class: Extended Part; Datasheet: https://item.szlcsc.com/datasheet/HX%2520TYPE-C%252016PIN/5834061.html; Supplier: LCSC; Connector Type: Type-C; Protocol Standard: USB 3.1; Gender: Female; Mounting Type: Surface Mount, Right Angle; Number of Contacts: 16P; Number of Ports: 1; Current Rating-Power: 3A; Voltage Rating: 20V; Connect-Disconnect Life: 5,000 Cycles; Center Height: 1.68mm; Length: 7.35mm; Detection color: Black; Operating Temperature: -30℃~+80℃
U5 = CH340N: Applications Function:USB to serial Protocol: Number of Channels:1 Voltage - Supply:3.3V；5V Voltage - Supply:3.3V；5V Data Rate:2Mbps Operating Temperature:-20℃~+70℃ Operating Temperature:-20℃~+70℃; LCSC Part Name: USB2.0芯片CH340; Supplier Part: C2977777; Manufacturer: WCH(南京沁恒); Supplier Footprint: SOP-8; JLCPCB Part Class: Extended Part; Datasheet: https://atta.szlcsc.com/upload/public/pdf/source/20240313/115CDE92081B1D6CB446704AD5D0F5F2.pdf; Supplier: LCSC; Applications Function: USB to serial; Number of Channels: 1; Voltage - Supply: 3.3V；5V; Data Rate: 2Mbps; Operating Temperature: -20℃~+70℃
U7 = PZ2.54-1*2: Pin Structure:1x2P Pitch:2.54mm Circluar Pins/Square Pins:Pin Header Mounting Type:Through Hole Number of Rows:1 Number of Pins:2P Current Rating:2.5A Length of Mating Pin:6mm Insulation Height:2.54mm Length of End Connection Pin:3mm Contact Material:Bras; LCSC Part Name: 1x2P 间距:2.54mm 方针 直插; Supplier Part: C5360898; Manufacturer: ZHOURI(洲日); Supplier Footprint: 插件,P=2.54mm; JLCPCB Part Class: Extended Part; Datasheet: https://item.szlcsc.com/datasheet/PZ2.54-1*2/6180457.html; Supplier: LCSC; Pin Structure: 1x2P; Pitch: 2.54mm; Circluar Pins/Square Pins: Pin Header; Mounting Type: Through Hole; Number of Rows: 1; Number of Pins: 2P; Current Rating: 2.5A; Length of Mating Pin: 6mm; Insulation Height: 2.54mm; Length of End Connection Pin: 3mm; Contact Material: Brass; Contact Plating: Gold; Operating Temperature: -40℃~+105℃

## Nets
3.3V: C2.2 C3.2 C4.2 C6.1 C8.1 C9.1 P4.1 R5.2 R30.1 R31.1 R33.1 U1.3(3V3) U2.5(VOUT) U5.5(VCC) U5.8(V3) U6.1(3V3) U6.2 U6.3 U6.4 U6.5 U6.6 U6.7 U6.8
GND: C1.1 C2.1 C3.1 C4.1 C5.2 C6.2 C8.2 C9.2 C10.1 D2.3 H1.4 LED7.1(-) LED8.1(-) LED10.1(C) LED11.1(C) LED12.1(C) LED13.1(-) LED14.1(-) LED15.1(-) LED16.1(K) LED20.2(K) P3.3 P4.2 R1.2 R3.1 R4.1 R32.2 SW1.3(C) SW1.4(D) SW2.3(C) SW2.4(D) SW3.3(C) SW3.4(D) SW4.3(C) SW4.4(D) SW5.3(C) SW5.4(D) SW6.3(C) SW6.4(D) SW7.3 U1.1(GND) U1.2(GND) U1.42(GND) U1.43(GND) U1.46(GND) U1.47(GND) U1.48(GND) U1.49(GND) U1.50(GND) U1.51(GND) U1.52(GND) U1.53(GND) U1.54(GND) U1.55(GND) U1.56(GND) U1.57(GND) U1.58(GND) U1.59(GND) U1.60(GND) U1.GND U2.2(GND) U3.1(-) U4.A12B1(GND) U4.B12A1(GND) U5.3(GND) U6.57 U6.58 U6.59 U6.60 U6.61 U6.62 U6.63 U6.64(GND)
VBAT: Q1.2(D) U3.2(+)
VBUS: D1.1(A) H1.1 Q1.1(G) R1.1 R34.1 U4.A9B4(VBUS) U4.B9A4(VBUS)
VIN: C1.2 D1.2(K) Q1.3(S) R2.1 U2.1(VIN)
BOOT: SW1.1(A) SW1.2(B) U1.4(IO0)
BUTTON1: SW3.1(A) SW3.2(B) U1.19(IO15)
BUTTON2: SW4.1(A) SW4.2(B) U1.36(IO40)
BUTTON3: SW5.1(A) SW5.2(B) U1.37(IO41)
BUTTON4: SW6.1(A) SW6.2(B) U1.38(IO42)
CC1: R3.2 U4.A5(CC1)
CC2: R4.2 U4.B5(CC2)
D+: D2.2 U4.A6(D+) U4.B6(D+) U5.1(UD+)
D-: D2.1 U4.A7(D-) U4.B7(D-) U5.2(UD-)
EN: SW7.2 U2.3(EN)
GPIO17: H2.1 P4.5 U1.21(IO17)
GPIO18: P1.2 U1.22(IO18)
GPIO21: H2.2 P4.6 U1.25(IO21)
LED1: R19.1 U1.5(IO1)
LED2: R20.1 U1.6(IO2)
LED3: R21.1 U1.8(IO4)
LED4: R22.1 U1.9(IO5)
LED5: R23.1 U1.10(IO6)
LED6: R24.1 U1.11(IO7)
RESET: C5.1 R5.1 SW2.1(A) SW2.2(B) U1.45(EN)
RX: H1.2 U1.39(TXD0) U5.7(RXD)
S3_D+: U1.24(IO20) U7.1
S3_D-: U1.23(IO19) U7.2
TX: H1.3 U1.40(RXD0) U5.6(TXD)
$1N5519: R2.2 SW7.1
$1N10299: C10.2 R32.1 U4.17(EH) U4.18(EH) U4.19(EH) U4.20(EH)
$2N3582: LED7.2(+) R30.2
$2N3586: LED8.2(+) R31.2
$2N10665: LED10.2(A) R19.2
$2N10669: LED11.2(A) R20.2
$2N10674: LED12.2(A) R21.2
$2N10679: LED13.2(+) R22.2
$2N10684: LED14.2(+) R23.2
$2N10689: LED15.2(+) R24.2
$2N11230: LED16.2(A) R34.2
$2N11275: LED20.1(A) R33.2
$3N280: U6.29 U6.30 U6.31 U6.32
$3N284: U6.25 U6.26 U6.27 U6.28
$3N297: U6.53 U6.54 U6.55 U6.56
$3N301: U6.49 U6.50 U6.51 U6.52
$3N305: U6.37 U6.38 U6.39 U6.40
$3N309: U6.41 U6.42 U6.43 U6.44
$3N313: U6.45 U6.46 U6.47 U6.48
$3N317: U6.33 U6.34 U6.35 U6.36
$3N331: U6.21 U6.22 U6.23 U6.24
$3N335: U6.13 U6.14 U6.15 U6.16
$3N339: U6.17 U6.18 U6.19 U6.20
$3N343: U6.9 U6.10 U6.11 U6.12
$3N824: P1.1 P2.3
$3N833: P2.2 P3.4

Not connected (* = marked no-connect by the designer): P1 3* 4*; P2 1* 4*; P3 1* 2*; P4 3* 4*; SW7 4* 5* 6* 7*; U1 7(IO3)* 12(IO8)* 13(IO9)* 14(IO10)* 15(IO11)* 16(IO12)* 17(IO13)* 18(IO14)* 20(IO16)* 26(IO26)* 27(IO47)* 28(IO33)* 29(IO34)* 30(IO48)* 31(IO35)* 32(IO36)* 33(IO37)* 34(IO38)* 35(IO39)* 41(IO45)* 44(IO46)*; U2 4(NC)*; U4 A8(SBU1)* B8(SBU2)*; U5 4(RTS#)*

## Notes on the sheets
sheet 1
- ESP32-S3 MCU
- DEBUG
- POWER REGULATION & FILTERING
- SERIAL UART
- USB-C
- AAA BATTERY
- SYSTEM BUTTONS
sheet 2
- PROGRAMMABLE BUTTONS
- SOLDERABLE LEDS
- REVERSE MOUNT LEDS
- SYSTEM INDICATOR LEDS
sheet 3
- MAIN BREADBOARD
- BREADBOARD GPIO
- SOLDER PUZZLE
- SAO
